# Altium schematic sheet POWER_CLK.SchDoc: Clock Supply
size A3; SheetNumber: 9; SheetTotal: 17
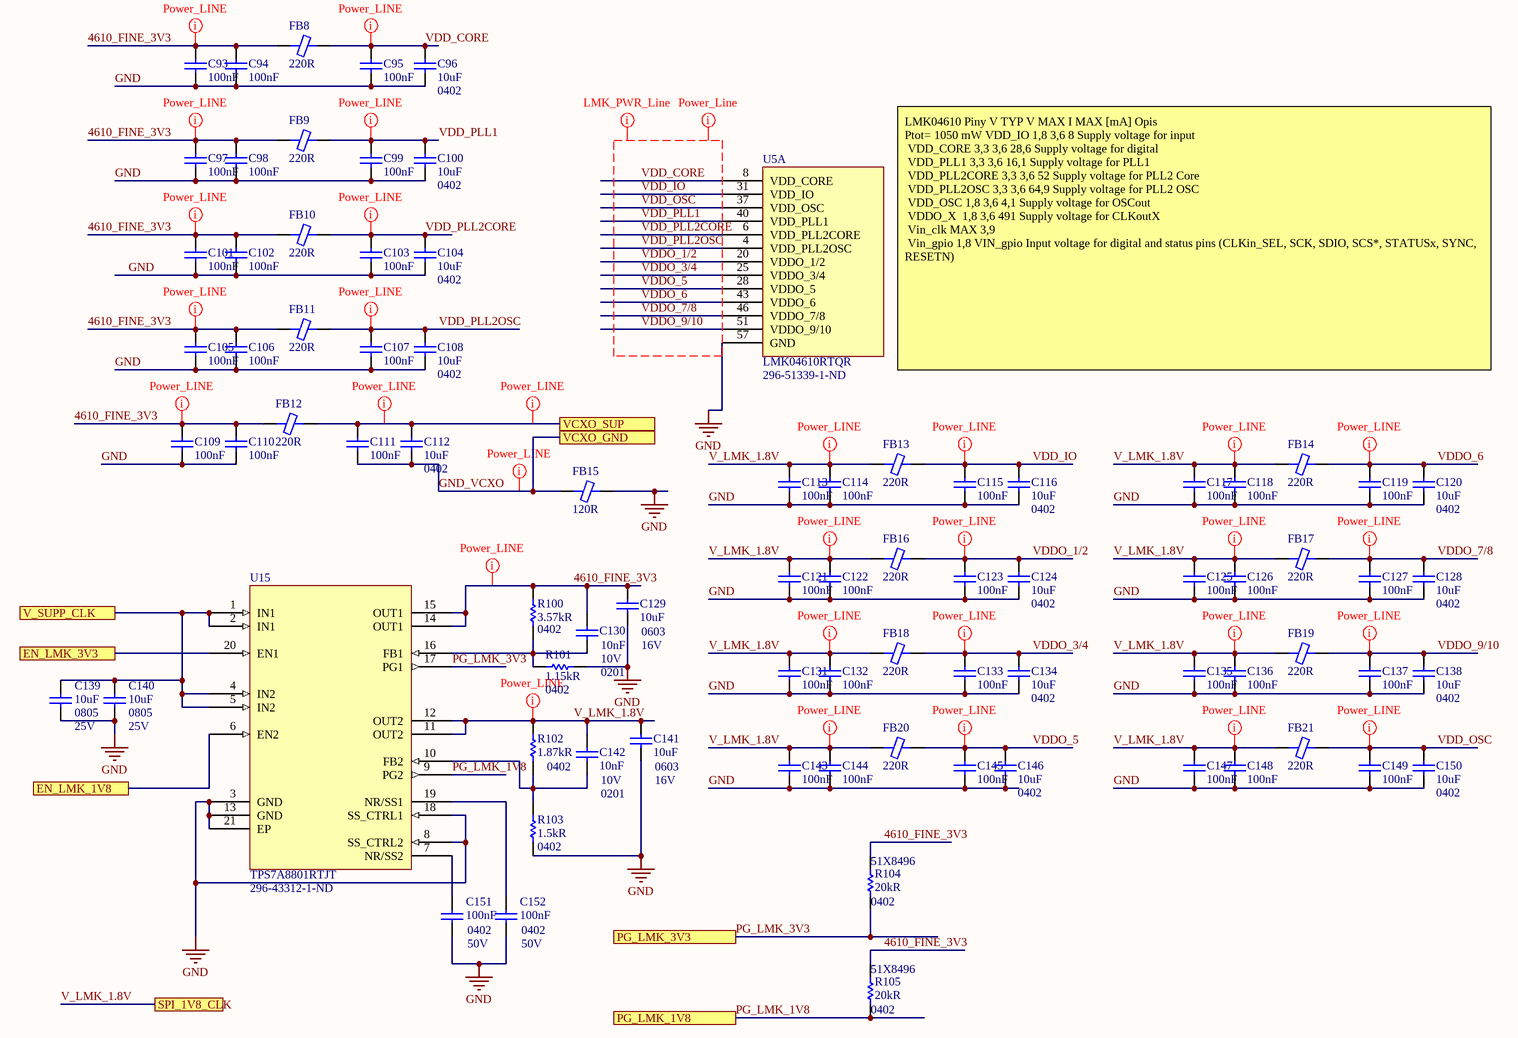
[diagram p0: POWER_CLK.SchDoc]

## Parts
C93  100nF  [CAP 0201/0603 KK]
C94  100nF  [CAP 0201/0603 KK]
C95  100nF  [CAP 0201/0603 KK]
C96  10uF  Case/Package: 0402  [CAP 0402/1005 RF KK]
C97  100nF  [CAP 0201/0603 KK]
C98  100nF  [CAP 0201/0603 KK]
C99  100nF  [CAP 0201/0603 KK]
C100  10uF  Case/Package: 0402  [CAP 0402/1005 RF KK]
C101  100nF  [CAP 0201/0603 KK]
C102  100nF  [CAP 0201/0603 KK]
C103  100nF  [CAP 0201/0603 KK]
C104  10uF  Case/Package: 0402  [CAP 0402/1005 RF KK]
C105  100nF  [CAP 0201/0603 KK]
C106  100nF  [CAP 0201/0603 KK]
C107  100nF  [CAP 0201/0603 KK]
C108  10uF  Case/Package: 0402  [CAP 0402/1005 RF KK]
C109  100nF  [CAP 0201/0603 KK]
C110  100nF  [CAP 0201/0603 KK]
C111  100nF  [CAP 0201/0603 KK]
C112  10uF  Case/Package: 0402  [CAP 0402/1005 RF KK]
C113  100nF  [CAP 0201/0603 KK]
C114  100nF  [CAP 0201/0603 KK]
C115  100nF  [CAP 0201/0603 KK]
C116  10uF  Case/Package: 0402  [CAP 0402/1005 RF KK]
C117  100nF  [CAP 0201/0603 KK]
C118  100nF  [CAP 0201/0603 KK]
C119  100nF  [CAP 0201/0603 KK]
C120  10uF  Case/Package: 0402  [CAP 0402/1005 RF KK]
C121  100nF  [CAP 0201/0603 KK]
C122  100nF  [CAP 0201/0603 KK]
C123  100nF  [CAP 0201/0603 KK]
C124  10uF  Case/Package: 0402  [CAP 0402/1005 RF KK]
C125  100nF  [CAP 0201/0603 KK]
C126  100nF  [CAP 0201/0603 KK]
C127  100nF  [CAP 0201/0603 KK]
C128  10uF  Case/Package: 0402  [CAP 0402/1005 RF KK]
C129  10uF  Case/Package: 0603  Voltage Rating: 16V  [CAP 0603/1608 RF]
C130  10nF  Case/Package: 0201  Voltage Rating: 10V  [CAP 0201/0603 KK]
C131  100nF  [CAP 0201/0603 KK]
C132  100nF  [CAP 0201/0603 KK]
C133  100nF  [CAP 0201/0603 KK]
C134  10uF  Case/Package: 0402  [CAP 0402/1005 RF KK]
C135  100nF  [CAP 0201/0603 KK]
C136  100nF  [CAP 0201/0603 KK]
C137  100nF  [CAP 0201/0603 KK]
C138  10uF  Case/Package: 0402  [CAP 0402/1005 RF KK]
C139  10uF  Case/Package: 0805  Voltage Rating: 25V  [CAP 0805/2012 RF]
C140  10uF  Case/Package: 0805  Voltage Rating: 25V  [CAP 0805/2012 RF]
C141  10uF  Case/Package: 0603  Voltage Rating: 16V  [CAP 0603/1608 RF]
C142  10nF  Case/Package: 0201  Voltage Rating: 10V  [CAP 0201/0603 KK]
C143  100nF  [CAP 0201/0603 KK]
C144  100nF  [CAP 0201/0603 KK]
C145  100nF  [CAP 0201/0603 KK]
C146  10uF  Case/Package: 0402  [CAP 0402/1005 RF KK]
C147  100nF  [CAP 0201/0603 KK]
C148  100nF  [CAP 0201/0603 KK]
C149  100nF  [CAP 0201/0603 KK]
C150  10uF  Case/Package: 0402  [CAP 0402/1005 RF KK]
C151  100nF  Case Code (Imperial): 0402  Voltage: 50V  [CAP 0402/1005 RF KK]
C152  100nF  Case Code (Imperial): 0402  Voltage: 50V  [CAP 0402/1005 RF KK]
FB8  220R  [FER 0603/1608 KK]
FB9  220R  [FER 0603/1608 KK]
FB10  220R  [FER 0603/1608 KK]
FB11  220R  [FER 0603/1608 KK]
FB12  220R  [FER 0603/1608 KK]
FB13  220R  [FER 0603/1608 KK]
FB14  220R  [FER 0603/1608 KK]
FB15  120R  [FER 0603/1608 KK]
FB16  220R  [FER 0603/1608 KK]
FB17  220R  [FER 0603/1608 KK]
FB18  220R  [FER 0603/1608 KK]
FB19  220R  [FER 0603/1608 KK]
FB20  220R  [FER 0603/1608 KK]
FB21  220R  [FER 0603/1608 KK]
R100  3.57kR  Case/Package: 0402  [RES 0402/1005 RF KK]
R101  1.15kR  Case/Package: 0402  [RES 0402/1005 RF KK]
R102  1.87kR  Case/Package: 0402  [RES 0402/1005 RF KK]
R103  1.5kR  Case/Package: 0402  [RES 0402/1005 RF KK]
R104  20kR  Supplier Part Number 1: 51X8496  Case Code (Imperial): 0402  [RES 0402/1005 RF KK]
R105  20kR  Supplier Part Number 1: 51X8496  Case Code (Imperial): 0402  [RES 0402/1005 RF KK]
U5  LMK04610RTQR  Supplier Part Number 1: 296-51339-1-ND  [LMK04610]  (part A of 4)
U15  TPS7A8801RTJT  Supplier Part Number 1: 296-43312-1-ND  [TPS7A88]

## Ports
EN_LMK_1V8, EN_LMK_3V3, PG_LMK_1V8, PG_LMK_3V3, SPI_1V8_CLK, V_SUPP_CLK, VCXO_GND, VCXO_SUP

## Nets
GND: C93.1 C94.1 C95.1 C96.1 C97.1 C98.1 C99.1 C100.1 C101.1 C102.1 C103.1 C104.1 C105.1 C106.1 C107.1 C108.1 C109.1 C110.1 C113.1 C114.1 C115.1 C116.1 C117.1 C118.1 C119.1 C120.1 C121.1 C122.1 C123.1 C124.1 C125.1 C126.1 C127.1 C128.1 C129.1 C131.1 C132.1 C133.1 C134.1 C135.1 C136.1 C137.1 C138.1 C139.1 C140.1 C141.1 C143.1 C144.1 C145.1 C146.1 C147.1 C148.1 C149.1 C150.1 C151.1 C152.1 FB15.2 R101.1 R103.2 U5.57(GND) U15.3(GND) U15.8(SS_CTRL2) U15.13(GND) U15.18(SS_CTRL1) U15.21(EP)
4610_FINE_3V3: C93.2 C94.2 C97.2 C98.2 C101.2 C102.2 C105.2 C106.2 C109.2 C110.2 C129.2 C130.2 FB8.1 FB9.1 FB10.1 FB11.1 FB12.1 R100.2 R104.2 R105.2 U15.14(OUT1) U15.15(OUT1)
EN_LMK_1V8: U15.6(EN2) ; port EN_LMK_1V8
EN_LMK_3V3: U15.20(EN1) ; port EN_LMK_3V3
GND_VCXO: C111.1 C112.1 FB15.1 ; port VCXO_GND
PG_LMK_1V8: R105.1 U15.9(PG2) ; port PG_LMK_1V8
PG_LMK_3V3: R104.1 U15.17(PG1) ; port PG_LMK_3V3
V_LMK_1.8V: C113.2 C114.2 C117.2 C118.2 C121.2 C122.2 C125.2 C126.2 C131.2 C132.2 C135.2 C136.2 C141.2 C142.2 C143.2 C144.2 C147.2 C148.2 FB13.1 FB14.1 FB16.1 FB17.1 FB18.1 FB19.1 FB20.1 FB21.1 R102.2 U15.11(OUT2) U15.12(OUT2) ; port SPI_1V8_CLK
V_SUPP_CLK: C139.2 C140.2 U15.1(IN1) U15.2(IN1) U15.4(IN2) U15.5(IN2) ; port V_SUPP_CLK
VCXO_SUP: C111.2 C112.2 FB12.2 ; port VCXO_SUP
VDD_CORE: C95.2 C96.2 FB8.2 U5.8(VDD_CORE)
VDD_IO: C115.2 C116.2 FB13.2 U5.31(VDD_IO)
VDD_OSC: C149.2 C150.2 FB21.2 U5.37(VDD_OSC)
VDD_PLL1: C99.2 C100.2 FB9.2 U5.40(VDD_PLL1)
VDD_PLL2CORE: C103.2 C104.2 FB10.2 U5.6(VDD_PLL2CORE)
VDD_PLL2OSC: C107.2 C108.2 FB11.2 U5.4(VDD_PLL2OSC)
VDDO_1/2: C123.2 C124.2 FB16.2 U5.20(VDDO_1/2)
VDDO_3/4: C133.2 C134.2 FB18.2 U5.25(VDDO_3/4)
VDDO_5: C145.2 C146.2 FB20.2 U5.28(VDDO_5)
VDDO_6: C119.2 C120.2 FB14.2 U5.43(VDDO_6)
VDDO_7/8: C127.2 C128.2 FB17.2 U5.46(VDDO_7/8)
VDDO_9/10: C137.2 C138.2 FB19.2 U5.51(VDDO_9/10)
NetC130_1: C130.1 R100.1 R101.2 U15.16(FB1)
NetC142_1: C142.1 R102.1 R103.1 U15.10(FB2)
NetC151_2: C151.2 U15.7(NR/SS2)
NetC152_2: C152.2 U15.19(NR/SS1)

## Layout directives
net class Power_LINE: 4610_FINE_3V3, GND_VCXO, V_LMK_1.8V, VCXO_SUP, VDD_CORE, VDD_IO, VDD_OSC, VDD_PLL1, VDD_PLL2CORE, VDD_PLL2OSC, VDDO_1/2, VDDO_3/4, VDDO_5, VDDO_6, VDDO_7/8, VDDO_9/10
net class LMK_PWR_Line: VDD_CORE, VDD_IO, VDD_OSC, VDD_PLL1, VDD_PLL2CORE, VDD_PLL2OSC, VDDO_1/2, VDDO_3/4, VDDO_5, VDDO_6, VDDO_7/8, VDDO_9/10
net class Power_Line: VDD_CORE, VDD_IO, VDD_OSC, VDD_PLL1, VDD_PLL2CORE, VDD_PLL2OSC, VDDO_1/2, VDDO_3/4, VDDO_5, VDDO_6, VDDO_7/8, VDDO_9/10

## Notes on the sheet
- LMK04610	Piny	V TYP	V MAX	I MAX [mA]	Opis
  Ptot= 1050 mW	VDD_IO	1,8	3,6	8	Supply voltage for input
  VDD_CORE	3,3	3,6	28,6	Supply voltage for digital
  VDD_PLL1	3,3	3,6	16,1	Supply voltage for PLL1
  VDD_PLL2CORE	3,3	3,6	52	Supply voltage for PLL2 Core
  VDD_PLL2OSC	3,3	3,6	64,9	Supply voltage for PLL2 OSC
  VDD_OSC	1,8	3,6	4,1	Supply voltage for OSCout
  VDDO_X		1,8	3,6	491	Supply voltage for CLKoutX
  Vin_clk	MAX 3,9
  Vin_gpio	1,8 VIN_gpio Input voltage for digital and status pins (CLKin_SEL, SCK, SDIO, SCS*, STATUSx, SYNC, RESETN)
- Title
- Size:
- Date:
- A3
- Number:
- Time:
- Revision:
- Sheet
- of
- File:

## Library data of the parts
C93-C95 C97-C99 C101-C103 C105-C107 C109-C111 C113-C115 C117-C119 C121-C123 C125-C127 C131-C133 C135-C137 C143-C145 C147-C149 = Capacitor: Manufacturer 1: Murata; Manufacturer Part Number 1: GRM033R61C104ME84D; Voltage Rating: 16V; Tolerance: 20%; Dielectric: X5R; Supplier 1: Digi-Key; Supplier Part Number 1: 490-9986-1-ND; Stock 1: 503570; Pricing 1: 1=0.10000, 10=0.05400, 100=0.02430, 500=0.01732, 1000=0.01361, 2500=0.01238, 5000=0.01139 (USD); RoHS: Yes; Mount: Surface Mount; Case/Package: 0201; Weight: 1.2E-05oz; Case Code (Metric): 0603; Case Code (Imperial): 0201; Min Operating Temperature: -55°C; Max Operating Temperature: 85°C; Capacitance: 100nF; Packaging: Tape and Reel; Termination: SMD/SMT; Voltage Rating (DC): 16V; Package Quantity: 15000; Length: 0.024inch; Height: 0.3mm; Width: 0.3mm; Thickness: 0.013inch; ComponentLink1URL: http://www.mouser.com/ds/2/281/c02e-2905.pdf?src-supplier=Mouser; ComponentLink1Description: http://www.mouser.com/ds/2/281/c02e-2905.pdf?src-supplier=Mouser; ComponentLink2URL: http://search.murata.co.jp/Ceramy/image/img/A01X/G101/ENG/GRM033R61C104ME84-01.pdf?src-supplier=Digi-Key; ComponentLink2Description: http://search.murata.co.jp/Ceramy/image/img/A01X/G101/ENG/GRM033R61C104ME84-01.pdf?src-supplier=Digi-Key
C96 C100 C104 C108 C112 C116 C120 C124 C128 C134 C138 C146 C150 = Capacitor: CAP CER 10UF 6.3V X5R 0402; Manufacturer: Murata; Manufacturer Part Number: GRJ155R60J106ME11D; Tolerance: 20%; Supplier 1: Digi-Key; Supplier Part Number 1: 490-13211-1-ND; RoHS: Yes; Category: Ceramic Capacitors; Stock 1: 1136490; Pricing 1: 1=0,21000, 10=0,14500, 50=0,08680, 100=0,07330, 500=0,05016, 1000=0,04436, 2500=0,04244, 5000=0,03858 (USD); Mount: Surface Mount; Case Code (Metric): 1005; Case Code (Imperial): 0402; Min Operating Temperature: -55°C; Max Operating Temperature: 85°C; Packaging: Cut Tape; Capacitance: 10uF; Voltage Rating: 6.3V; Features: Soft Termination; Length: 0.039inch; Width: 0.02inch; Thickness: 0.028inch; ComponentLink1URL: http://psearch.en.murata.com/capacitor/product/GRJ155R60J106ME11%23.pdf?src-supplier=Digi-Key; ComponentLink1Description: http://psearch.en.murata.com/capacitor/product/GRJ155R60J106ME11%23.pdf?src-supplier=Digi-Key
C129 C141 = Capacitor: 0603 10 uF 16 V ±10% Tolerance X5R Multilayer Ceramic Capacitor; Manufacturer: Murata; Manufacturer Part Number: GRM188R61C106KAALJ; Supplier 1: Digi-Key; Supplier Part Number 1: 490-12736-1-ND; RoHS: Yes; Category: Ceramic Capacitors; Stock 1: 68393; Pricing 1: 1=0,43000, 10=0,29900, 100=0,17910, 500=0,13434, 1000=0,11345, 2500=0,10748, 5000=0,10150 (USD); Mount: Surface Mount; Weight: 0.000222oz; Case Code (Imperial): 0603; Case Code (Metric): 1608; Min Operating Temperature: -55°C; Max Operating Temperature: 85°C; Tolerance: 10%; Packaging: Tape and Reel; Capacitance: 10uF; Dielectric: X5R; Termination: SMD/SMT; Composition: Ceramic; Voltage Rating (DC): 16V; Package Quantity: 10000; Length: 0.063inch; Height: 0.8mm; Width: 0.031inch; Thickness: 0.037inch; ComponentLink1URL: http://www.mouser.com/ds/2/281/GRM188R61C106KAAL-01-1064790.pdf?src-supplier=Mouser; ComponentLink1Description: http://www.mouser.com/ds/2/281/GRM188R61C106KAAL-01-1064790.pdf?src-supplier=Mouser; ComponentLink2URL: http://search.murata.co.jp/Ceramy/image/img/A01X/G101/ENG/GRM188R61C106KAAL-01.pdf?src-supplier=Digi-Key; ComponentLink2Description: http://search.murata.co.jp/Ceramy/image/img/A01X/G101/ENG/GRM188R61C106KAAL-01.pdf?src-supplier=Digi-Key
C130 C142 = Capacitor: Multilayer Ceramic Capacitors MLCC - SMD/SMT 0.01uF 10 volts 10%; Manufacturer: Murata; Manufacturer Part Number: GRM033R61A103KA01J; Dielectric: X5R; Supplier 1: Digi-Key; Supplier Part Number 1: 490-8156-1-ND; RoHS: Yes; Category: Ceramic Capacitors; Stock 1: 128195; Pricing 1: 1=0,10000, 10=0,02900, 100=0,01300, 500=0,00932, 1000=0,00732, 2500=0,00666, 5000=0,00612 (USD); Mount: Surface Mount; Case Code (Metric): 0603; Case Code (Imperial): 0201; Min Operating Temperature: -55°C; Max Operating Temperature: 85°C; Termination: SMD/SMT; Package Quantity: 50000; Packaging: Tape and Reel; Capacitance: 10nF; Tolerance: 10%; Voltage Rating (DC): 10V; Length: 0.6mm; Height: 0.3mm; Thickness: 0.013inch; Depth: 0.3mm; Width: 0.012inch; Radiation Hardening: No; Lead Free: Lead Free; ComponentLink1URL: https://datasheet.ciiva.com/29542/grm033r61a103ka01-01-29542528.pdf?src-supplier=Digi-Key; ComponentLink1Description: https://datasheet.ciiva.com/29542/grm033r61a103ka01-01-29542528.pdf?src-supplier=Digi-Key; ComponentLink2URL: https://datasheet.ciiva.com/11620/product-11620086.pdf?src-supplier=Avnet; ComponentLink2Description: https://datasheet.ciiva.com/11620/product-11620086.pdf?src-supplier=Avnet; ComponentLink3URL: https://datasheet.ciiva.com/29542/grm033r61a103ka01-01-29542527.pdf?src-supplier=Digi-Key; ComponentLink3Description: https://datasheet.ciiva.com/29542/grm033r61a103ka01-01-29542527.pdf?src-supplier=Digi-Key; ComponentLink4URL: https://datasheet.ciiva.com/29542/grm033r61a103ka01-01-29542526.pdf?src-supplier=Digi-Key; ComponentLink4Description: https://datasheet.ciiva.com/29542/grm033r61a103ka01-01-29542526.pdf?src-supplier=Digi-Key
C139 C140 = Capacitor: CAP CER 10UF 25V X5R 0805; Manufacturer: KEMET; Manufacturer Part Number: C0805C106K3PACTU; Dielectric Material: Ceramic; Dissipation Factor: 10%; Supplier 1: Digi-Key; Supplier Part Number 1: 399-11939-6-ND; RoHS: Yes; Category: Ceramic Capacitors; Stock 1: 4800; Pricing 1: 1=0,24000, 10=0,16800, 100=0,09510, 500=0,06710, 1000=0,05872 (USD); Mount: Surface Mount; Case Code (Metric): 2012; Case Code (Imperial): 0805; Min Operating Temperature: -55°C; Max Operating Temperature: 85°C; Dielectric: X5R; Packaging: Cut Tape; Voltage: 25V; Termination: Solder; Tolerance: 10%; Voltage Rating (DC): 25V; Capacitance: 10uF; Length: 0.079inch; Height: 1.25mm; Depth: 1.25mm; Width: 0.049inch; Thickness: 0.057inch; REACH SVHC: No SVHC; Lead Free: Lead Free; ComponentLink1URL: http://www.farnell.com/datasheets/2741185.pdf?src-supplier=Farnell; ComponentLink1Description: http://www.farnell.com/datasheets/2741185.pdf?src-supplier=Farnell; ComponentLink2URL: http://www.farnell.com/datasheets/2112054.pdf?src-supplier=Farnell; ComponentLink2Description: http://www.farnell.com/datasheets/2112054.pdf?src-supplier=Farnell; ComponentLink3URL: http://www.alliedelec.com/m/d/f3c02ddb98afa3dd1adcb801109671e9.pdf?src-supplier=Allied+Electronics; ComponentLink3Description: http://www.alliedelec.com/m/d/f3c02ddb98afa3dd1adcb801109671e9.pdf?src-supplier=Allied+Electronics; ComponentLink4URL: http://www.farnell.com/datasheets/2112054.pdf?src-supplier=Element14; ComponentLink4Description: http://www.farnell.com/datasheets/2112054.pdf?src-supplier=Element14; ComponentLink5URL: https://api.kemet.com/component-edge/download/datasheet/C0805C106K3PAC7800.pdf?src-supplier=Digi-Key; ComponentLink5Description: https://api.kemet.com/component-edge/download/datasheet/C0805C106K3PAC7800.pdf?src-supplier=Digi-Key; ComponentLink6URL: http://www.kemet.com/docfinder?Partnumber=C0805C106K3PAC7800&src-supplier=Digi-Key; ComponentLink6Description: http://www.kemet.com/docfinder?Partnumber=C0805C106K3PAC7800&src-supplier=Digi-Key; ComponentLink7URL: http://www.kemet.com/Lists/ProductCatalog/Attachments/19/KEM_C1006_X5R_SMD.pdf?src-supplier=Avnet; ComponentLink7Description: http://www.kemet.com/Lists/ProductCatalog/Attachments/19/KEM_C1006_X5R_SMD.pdf?src-supplier=Avnet
C151 C152 = Capacitor: CAP CER 0.1UF 50V X5R 0402; Manufacturer: Murata; Manufacturer Part Number: GRM155R61H104KE14D; Dielectric Material: Ceramic; Dissipation Factor: 0.025%; Tolerance: 10%; Supplier 1: Digi-Key; Supplier Part Number 1: 490-10697-1-ND; RoHS: Yes; Category: Ceramic Capacitors; Stock 1: 435607; Pricing 1: 1=0,10000, 10=0,04600, 100=0,02050, 500=0,01464, 1000=0,01150, 2500=0,01045, 5000=0,00961 (USD); Mount: Surface Mount; Case/Package: 0402; Weight: 0.000212oz; Case Code (Metric): 1005; Min Operating Temperature: -55°C; Max Operating Temperature: 85°C; Capacitance: 100nF; Packaging: Tape and Reel; Voltage Rating: 50V; Dielectric: X5R; Termination: SMD/SMT; Composition: Ceramic; Voltage Rating (DC): 50V; Package Quantity: 10000; Length: 1mm; Height: 0.5mm; Width: 0.02inch; Thickness: 0.022inch; Depth: 0.5mm; REACH SVHC: No SVHC; Lead Free: Lead Free; ComponentLink1URL: http://www.farnell.com/datasheets/2079150.pdf?src-supplier=Farnell; ComponentLink1Description: http://www.farnell.com/datasheets/2079150.pdf?src-supplier=Farnell; ComponentLink2URL: http://www.mouser.com/ds/2/281/c02e-2905.pdf?src-supplier=Mouser; ComponentLink2Description: http://www.mouser.com/ds/2/281/c02e-2905.pdf?src-supplier=Mouser; ComponentLink3URL: http://www.farnell.com/datasheets/2079150.pdf?src-supplier=Element14; ComponentLink3Description: http://www.farnell.com/datasheets/2079150.pdf?src-supplier=Element14; ComponentLink4URL: http://search.murata.co.jp/Ceramy/image/img/A01X/G101/ENG/GRM155R61H104KE14-01.pdf?src-supplier=Digi-Key; ComponentLink4Description: http://search.murata.co.jp/Ceramy/image/img/A01X/G101/ENG/GRM155R61H104KE14-01.pdf?src-supplier=Digi-Key
FB8-FB14 FB16-FB21 = Ferrite: Manufacturer 1: Samsung; Manufacturer Part Number 1: CIS10P221NC; Current Rating: 2.5A; Tolerance: 25%; Number of Lines: 1; DC Resistance (DCR): 50mR; Supplier 1: Digi-Key; Supplier Part Number 1: 1276-6350-2-ND; Stock 1: 336000; Pricing 1: 4000=0.00880, 8000=0.00660, 12000=0.00638, 28000=0.00616, 100000=0.00572 (USD); RoHS: Yes; Mount: Surface Mount; Case/Package: 0603; Core Material: Ferrite; Case Code (Metric): 1608; Case Code (Imperial): 0603; Min Operating Temperature: -55°C; Max Operating Temperature: 125°C; Package Quantity: 1; Packaging: Cut Tape; Impedance: 220R; Max Current Rating: 2.5A; Max DC Current: 2.5A; Length: 0.063inch; Height: 0.037inch; Width: 0.031inch; Depth: 0.8mm; Radiation Hardening: No; Lead Free: Lead Free; ComponentLink1URL: https://datasheet.ciiva.com/29994/cis10p101ac-29994155.pdf?src-supplier=Avnet; ComponentLink1Description: https://datasheet.ciiva.com/29994/cis10p101ac-29994155.pdf?src-supplier=Avnet; ComponentLink2URL: https://datasheet.ciiva.com/16395/cic21-series-16395893.pdf?src-supplier=Future+Electronics; ComponentLink2Description: https://datasheet.ciiva.com/16395/cic21-series-16395893.pdf?src-supplier=Future+Electronics
FB15 = Ferrite: Manufacturer 1: TDK; Manufacturer Part Number 1: MPZ1608S121ATAH0; Current Rating: 2A; Tolerance: 25%; DC Resistance (DCR): 45mR; Supplier 1: Digi-Key; Supplier Part Number 1: 445-5219-1-ND; Stock 1: 68096; Pricing 1: 1=0.10000, 10=0.07900, 25=0.07160, 50=0.06440, 100=0.04720, 250=0.03432, 500=0.03146, 1000=0.02717 (USD); RoHS: Yes; Mount: Surface Mount; Case/Package: 0603; Core Material: Ferrite; Case Code (Metric): 1608; Case Code (Imperial): 0603; Package Quantity: 4000; Packaging: Tape and Reel; Impedance: 120R; Max DC Current: 2A; Length: 0.063inch; Height: 0.03inch; Width: 0.031inch; Depth: 0.8mm; ComponentLink1URL: https://datasheet.ciiva.com/46634/beads-commercial-power-mpz-en-46634726.pdf?src-supplier=Digi-Key; ComponentLink1Description: https://datasheet.ciiva.com/46634/beads-commercial-power-mpz-en-46634726.pdf?src-supplier=Digi-Key; ComponentLink2URL: https://datasheet.ciiva.com/46634/beads-commercial-power-mpz-en-46634728.pdf?src-supplier=Digi-Key; ComponentLink2Description: https://datasheet.ciiva.com/46634/beads-commercial-power-mpz-en-46634728.pdf?src-supplier=Digi-Key; ComponentLink3URL: https://datasheet.ciiva.com/48682/beads-commercial-power-mpz-en-48682494.pdf?src-supplier=Avnet; ComponentLink3Description: https://datasheet.ciiva.com/48682/beads-commercial-power-mpz-en-48682494.pdf?src-supplier=Avnet
R100 = Resistor: Thick Film Resistors - SMD 3.57K OHM 1%; Manufacturer: Yageo; Manufacturer Part Number: RC0402FR-073K57L; Power Rating: 62.5mW; Voltage Rating: 50V; Max Power Dissipation: 63mW; Temperature Coefficient: 100ppm/°C; Supplier 1: Digi-Key; Supplier Part Number 1: YAG3150CT-ND; RoHS: Yes; Category: Chip SMD Resistors; Stock 1: 898047; Pricing 1: 1=0,10000, 10=0,01600, 100=0,00640, 1000=0,00289, 2500=0,00251, 5000=0,00207 (USD); Case Code (Imperial): 0402; Case Code (Metric): 1005; Contact Plating: Tin,Matte; Min Operating Temperature: -55°C; Max Operating Temperature: 155°C; Tolerance: 1%; Packaging: Tape and Reel; Resistance: 3.57kR; Composition: Thick Film; Number of Terminations: 2; Termination: SMD/SMT; Military Standard: Not; Working Voltage: 50V; Features: Moisture Resistant; Length: 1mm; Height: 0.016inch; Width: 0.02inch; Depth: 0.5mm; Lead Free: Lead Free; ComponentLink1URL: https://datasheet.ciiva.com/16857/pyu-rc0402-51-rohs-l-6-16857623.pdf?src-supplier=Avnet+Europe; ComponentLink1Description: https://datasheet.ciiva.com/16857/pyu-rc0402-51-rohs-l-6-16857623.pdf?src-supplier=Avnet+Europe; ComponentLink2URL: https://datasheet.ciiva.com/8893/pyu-rc0402-51-rohs-l-6-8893597.pdf?src-supplier=Avnet; ComponentLink2Description: https://datasheet.ciiva.com/8893/pyu-rc0402-51-rohs-l-6-8893597.pdf?src-supplier=Avnet
R101 = Resistor: Res General Purpose Thick Film 0402 1.15K Ohm 1% 1/16W ±100ppm/°C Molded SMD Paper T/R; Manufacturer: Yageo; Manufacturer Part Number: RC0402FR-071K15L; Power Rating: 62.5mW; Voltage Rating: 50V; Max Power Dissipation: 63mW; Supplier 1: Digi-Key; Supplier Part Number 1: YAG3033CT-ND; RoHS: Yes; Category: Chip SMD Resistors; Stock 1: 186720; Pricing 1: 1=0,10000, 10=0,01600, 100=0,00640, 1000=0,00289, 2500=0,00251, 5000=0,00207 (USD); Case Code (Imperial): 0402; Case Code (Metric): 1005; Contact Plating: Tin,Matte,Lead; Min Operating Temperature: -55°C; Max Operating Temperature: 155°C; Tolerance: 1%; Resistance: 1.15kR; Packaging: Tape and Reel; Composition: Thick Film; Number of Terminations: 2; Termination: SMD/SMT; Military Standard: Not; Temperature Coefficient: 100ppm/°C; Voltage Rating (DC): 50V; Features: Moisture Resistant; Length: 1mm; Height: 0.016inch; Width: 0.02inch; Depth: 0.5mm; Radiation Hardening: No; Lead Free: Lead Free; ComponentLink1URL: https://datasheet.ciiva.com/16856/pyu-rc0402-51-rohs-l-6-16856533.pdf?src-supplier=Avnet+Europe; ComponentLink1Description: https://datasheet.ciiva.com/16856/pyu-rc0402-51-rohs-l-6-16856533.pdf?src-supplier=Avnet+Europe; ComponentLink2URL: https://datasheet.ciiva.com/28418/pyu-rc0402-51-rohs-l-6-28418808.pdf?src-supplier=Avnet+Europe; ComponentLink2Description: https://datasheet.ciiva.com/28418/pyu-rc0402-51-rohs-l-6-28418808.pdf?src-supplier=Avnet+Europe; ComponentLink3URL: https://datasheet.ciiva.com/8895/pyu-rc0402-51-rohs-l-6-8895884.pdf?src-supplier=Avnet; ComponentLink3Description: https://datasheet.ciiva.com/8895/pyu-rc0402-51-rohs-l-6-8895884.pdf?src-supplier=Avnet; ComponentLink4URL: https://datasheet.ciiva.com/26829/getdatasheetpartid-326427-26829948.pdf?src-supplier=Verical; ComponentLink4Description: https://datasheet.ciiva.com/26829/getdatasheetpartid-326427-26829948.pdf?src-supplier=Verical
R102 = Resistor: Manufacturer: Panasonic; Manufacturer Part Number: ERA-2AEB1871X; Power Rating: 62.5mW; Tolerance: 0.1%; Temperature Coefficient: 25ppm/°C; Max Power Dissipation: 63mW; Supplier 1: Digi-Key; Supplier Part Number 1: P1.87KDCCT-ND; Stock 1: 25484; Pricing 1: 1 = 0,45000, 10 = 0,32100, 100 = 0,12830, 1000 = 0,06322, 2500 = 0,05858, 5000 = 0,05300 (USD); RoHS: Yes; Mount: Surface Mount; Case Code (Metric): 1005; Case Code (Imperial): 0402; Min Operating Temperature: -55°C; Max Operating Temperature: 155°C; Resistance: 1.87kR; Packaging: Tape and Reel; Package Quantity: 10000; Composition: Thin Film; Number of Terminations: 2; Length: 0.039inch; Height: 0.016inch; Width: 0.02inch; Lead Free: Lead Free; ComponentLink1URL: https://media.digikey.com/pdf/Data%20Sheets/Panasonic%20Resistors%20Thermistors%20PDFs/ERA_Series_LE.pdf?src-supplier=Digi-Key; ComponentLink1Description: https://media.digikey.com/pdf/Data%20Sheets/Panasonic%20Resistors%20Thermistors%20PDFs/ERA_Series_LE.pdf?src-supplier=Digi-Key; ComponentLink2URL: http://components.arrow.com/part/dataview/48289000S454828N1386?src-supplier=Arrow; ComponentLink2Description: http://components.arrow.com/part/dataview/48289000S454828N1386?src-supplier=Arrow; ComponentLink3URL: http://www.mouser.com/ds/2/315/AOA0000C237-1100991.pdf?src-supplier=Mouser; ComponentLink3Description: http://www.mouser.com/ds/2/315/AOA0000C237-1100991.pdf?src-supplier=Mouser; ComponentLink4URL: http://www.onlinecomponents.com/datasheet/era-2aeb1871x.aspx?p=44473586&src-supplier=Onlinecomponents.com; ComponentLink4Description: http://www.onlinecomponents.com/datasheet/era-2aeb1871x.aspx?p=44473586&src-supplier=Onlinecomponents.com; ComponentLink5URL: https://industrial.panasonic.com/cdbs/www-data/pdf/RDM0000/AOA0000C307.pdf?src-supplier=Digi-Key; ComponentLink5Description: https://industrial.panasonic.com/cdbs/www-data/pdf/RDM0000/AOA0000C307.pdf?src-supplier=Digi-Key
R103 = Resistor: Manufacturer: Panasonic; Manufacturer Part Number: ERA-2AEB152X; Power Rating: 63mW; Tolerance: 0.1%; Voltage Rating: 25V; Temperature Coefficient: 25ppm/°C; Supplier 1: Digi-Key; Supplier Part Number 1: P1.5KDCCT-ND; Stock 1: 3629; Pricing 1: 1 = 0,43000, 10 = 0,30500, 100 = 0,12220, 1000 = 0,06021, 2500 = 0,05579, 5000 = 0,05047 (USD); RoHS: Yes; Mount: Surface Mount; Case Code (Metric): 1005; Case Code (Imperial): 0402; Contact Plating: Tin; Min Operating Temperature: -55°C; Max Operating Temperature: 155°C; Resistance: 1.5kR; Packaging: Tape and Reel; Package Quantity: 10000; Composition: Thin Film,Metal Film; Number of Terminations: 2; Termination: SMD/SMT; Military Standard: Not; Max Power Dissipation: 63mW; Voltage Rating (DC): 25V; Features: Automotive AEC-Q200; Length: 1mm; Height: 0.35mm; Width: 0.02inch; Depth: 0.5mm; Radiation Hardening: No; REACH SVHC: No SVHC; Lead Free: Lead Free; ComponentLink1URL: https://datasheet.ciiva.com/11812/0900766b80beefcc-11812726.pdf?src-supplier=RSComponents; ComponentLink1Description: https://datasheet.ciiva.com/11812/0900766b80beefcc-11812726.pdf?src-supplier=RSComponents; ComponentLink2URL: https://datasheet.ciiva.com/9198/aoa0000ce26-9198134.pdf?src-supplier=Avnet; ComponentLink2Description: https://datasheet.ciiva.com/9198/aoa0000ce26-9198134.pdf?src-supplier=Avnet; ComponentLink3URL: https://datasheet.ciiva.com/17214/aoa0000ce26-17214729.pdf?src-supplier=Avnet+Europe; ComponentLink3Description: https://datasheet.ciiva.com/17214/aoa0000ce26-17214729.pdf?src-supplier=Avnet+Europe; ComponentLink4URL: https://datasheet.ciiva.com/24071/aoa0000ce26-197354-24071641.pdf?src-supplier=Mouser; ComponentLink4Description: https://datasheet.ciiva.com/24071/aoa0000ce26-197354-24071641.pdf?src-supplier=Mouser
R104 R105 = Resistor: RES SMD 20K OHM 1% 1/16W 0402; Manufacturer: Vishay; Manufacturer Part Number: CRCW040220K0FKED; Power Rating: 63mW; Voltage Rating: 50V; Temperature Coefficient: 100ppm/°C; Supplier 1: Newark; RoHS: Yes; Category: Chip SMD Resistors; Mount: Surface Mount; Case/Package: 0402; Number of Pins: 2; Weight: 2.3E-05oz; Case Code (Metric): 1005; Contact Plating: Tin; Min Operating Temperature: -55°C; Max Operating Temperature: 155°C; Resistance: 20kR; Tolerance: 1%; Packaging: Tape and Reel; Composition: Thick Film; Voltage Rating (DC): 50V; Package Quantity: 10; Termination: SMD/SMT; Number of Terminations: 2; Military Standard: Not; Max Power Dissipation: 63mW; Features: Automotive AEC-Q200; Working Voltage: 50V; Length: 1mm; Height: 0.35mm; Width: 0.5mm; Depth: 0.5mm; Radiation Hardening: No; REACH SVHC: Unknown; Lead Free: Lead Free; ComponentLink1URL: https://datasheet.ciiva.com/11810/0900766b80d98824-11810023.pdf?src-supplier=RSComponents; ComponentLink1Description: https://datasheet.ciiva.com/11810/0900766b80d98824-11810023.pdf?src-supplier=RSComponents; ComponentLink2URL: https://datasheet.ciiva.com/2463/dcrcwe3-2463139.pdf?src-supplier=Digi-Key; ComponentLink2Description: https://datasheet.ciiva.com/2463/dcrcwe3-2463139.pdf?src-supplier=Digi-Key; ComponentLink3URL: https://datasheet.ciiva.com/2463/dcrcwe3-2463140.pdf?src-supplier=Digi-Key; ComponentLink3Description: https://datasheet.ciiva.com/2463/dcrcwe3-2463140.pdf?src-supplier=Digi-Key; ComponentLink4URL: https://datasheet.ciiva.com/16886/dcrcwe3-16886581.pdf?src-supplier=Avnet+Europe; ComponentLink4Description: https://datasheet.ciiva.com/16886/dcrcwe3-16886581.pdf?src-supplier=Avnet+Europe; ComponentLink5URL: https://datasheet.ciiva.com/15159/getdatasheetpartid-93312-15159927.pdf?src-supplier=Verical; ComponentLink5Description: https://datasheet.ciiva.com/15159/getdatasheetpartid-93312-15159927.pdf?src-supplier=Verical; ComponentLink6URL: https://datasheet.ciiva.com/2463/dcrcwe3-2463141.pdf?src-supplier=Digi-Key; ComponentLink6Description: https://datasheet.ciiva.com/2463/dcrcwe3-2463141.pdf?src-supplier=Digi-Key; ComponentLink7URL: https://datasheet.ciiva.com/3256/dcrcwe3-3256213.pdf?src-supplier=Avnet; ComponentLink7Description: https://datasheet.ciiva.com/3256/dcrcwe3-3256213.pdf?src-supplier=Avnet; ComponentLink8URL: https://datasheet.ciiva.com/16725/70201119-16725214.pdf?src-supplier=Allied+Electronics; ComponentLink8Description: https://datasheet.ciiva.com/16725/70201119-16725214.pdf?src-supplier=Allied+Electronics
U5 = LMK04610RTQR: Manufacturer: Texas Instruments; Number of Inputs: 2; Number of Outputs: 10; Supplier 1: Digi-Key; Manufacturer Part Number: LMK04610RTQR; Stock 1: 2022; Pricing 1: 1 = 20,47000, 10 = 18,87700, 100 = 16,11940, 500 = 14,63474 (USD); RoHS: No; Min Operating Temperature: -40°C; Max Operating Temperature: 85°C
U15 = TPS7A8801RTJT: IC REG LINEAR POS ADJ 1A 20QFN; Manufacturer: Texas Instruments; Output Voltage: 5V; Number of Regulators: 2; Min Current Limit: 1.5A; Quiescent Current: 2mA; Dropout Voltage: 130mV; Supplier 1: Digi-Key; Manufacturer Part Number: TPS7A8801RTJT; RoHS: Yes; Category: Voltage References; Stock 1: 1455; Pricing 1: 1=2,77000, 10=2,48700, 25=2,34600, 100=1,87670 (USD); Mount: Surface Mount; Case/Package: QFN; Number of Pins: 20; Min Operating Temperature: -40°C; Max Operating Temperature: 125°C; Packaging: Tape and Reel; Output Current: 1A; Number of Outputs: 2; Lead Free: Lead Free; ComponentLink1URL: http://www.ti.com/lit/gpn/tps7a88?src-supplier=Mouser; ComponentLink1Description: http://www.ti.com/lit/gpn/tps7a88?src-supplier=Mouser; ComponentLink2URL: http://www.ti.com/lit/ds/symlink/tps7a88.pdf?src-supplier=Digi-Key; ComponentLink2Description: http://www.ti.com/lit/ds/symlink/tps7a88.pdf?src-supplier=Digi-Key; ComponentLink3URL: http://www.ti.com/general/docs/lit/getliterature.tsp?genericPartNumber=TPS7A88&amp;&amp;fileType=pdf&src-supplier=Farnell; ComponentLink3Description: http://www.ti.com/general/docs/lit/getliterature.tsp?genericPartNumber=TPS7A88&amp;&amp;fileType=pdf&src-supplier=Farnell